# Altium schematic sheet Power.SchDoc
size A4; SheetNumber: 1; SheetTotal: 1
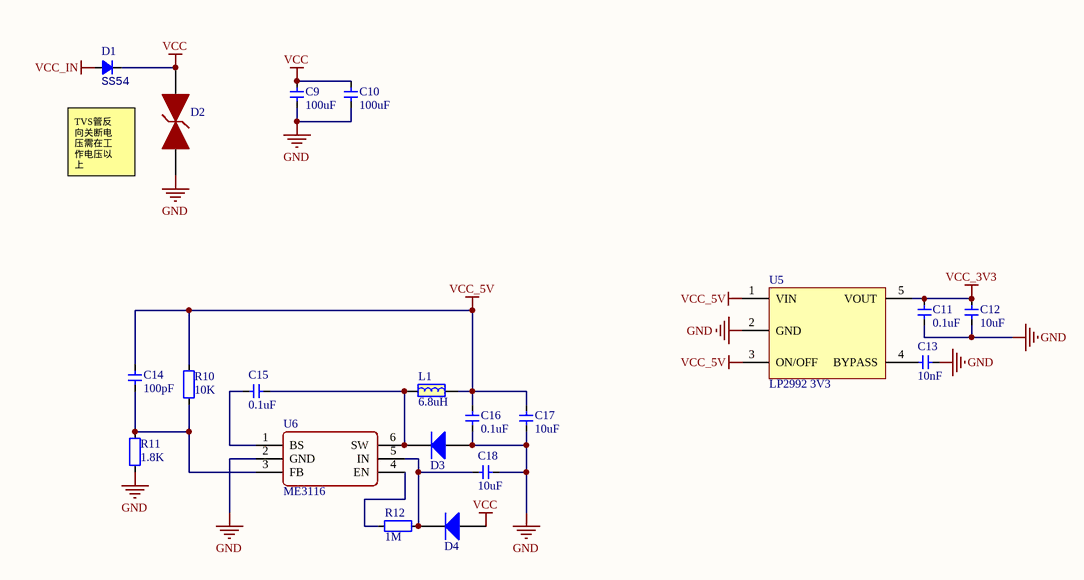
[diagram p0: Power.SchDoc]

## Parts
C9  100uF  [1206-CAP]
C10  100uF  [1206-CAP]
C11  0.1uF  [CAP_0402]
C12  10uF  [CAP_0402]
C13  10nF  [CAP_0402]
C14  100pF  [CAP_0402]
C15  0.1uF  [CAP_0402]
C16  0.1uF  [CAP_0402]
C17  10uF  [CAP_0402]
C18  10uF  [CAP_0402]
D1  SS54  [DO-214AC]
D2  SMBJ28CA  [SMBJ-CA_MFG]  (value not drawn)
D3  二极管-5819W  [SOD-323]  (value not drawn)
D4  二极管-5819W  [SOD-323]  (value not drawn)
L1  6.8uH  [IND-201612]
R10  10K  [RES_0402]
R11  1.8K  [RES_0402]
R12  1M  [RES_0402]
U5  LP2992 3V3  [SOT23-5]
U6  ME3116  [SOT23-6]

## Nets
GND: C9.1 C10.1 C11.1 C12.1 C13.1 C16.1 C17.1 C18.1 D2.1 D3.1(A) R11.1 U5.2(GND) U6.2(GND)
VCC: C9.2 C10.2 D1.2(K) D2.2 D4.1(A)
VCC_3V3: C11.2 C12.2 U5.5(VOUT)
VCC_5V: C14.1 C16.2 C17.2 L1.2 R10.2 U5.1(VIN) U5.3(ON/OFF)
VCC_IN: D1.1(A)
NetC13_2: C13.2 U5.4(BYPASS)
NetC14_2: C14.2 R10.1 R11.2 U6.3(FB)
NetC15_1: C15.1 D3.2(K) L1.1 U6.6(SW)
NetC15_2: C15.2 U6.1(BS)
NetC18_2: C18.2 D4.2(K) R12.1 U6.5(IN)
NetR12_2: R12.2 U6.4(EN)

## Notes on the sheet
- TVS管反
  向关断电
  压需在工
  作电压以
  上

## Library data of the parts
C9 C10 = 电容-1206: Capacitor; Value: 0.1u
C11-C18 = 电容-0402: Capacitor; Value: 0.1u
D1 = Diode_SMA: Diode; Type: SMA; Value: SS54
D3 D4 = 二极管-5819W: 40V
L1 = 电感-201612
R10-R12 = 电阻-0402: Resistor; Value: 22R
U5 = LP2992: LDO
U6 = ME3116: DC-DC